# EasyEDA Pro project alcometerLayout_v3.epro

# Board PCB_ESP32 Tutorial
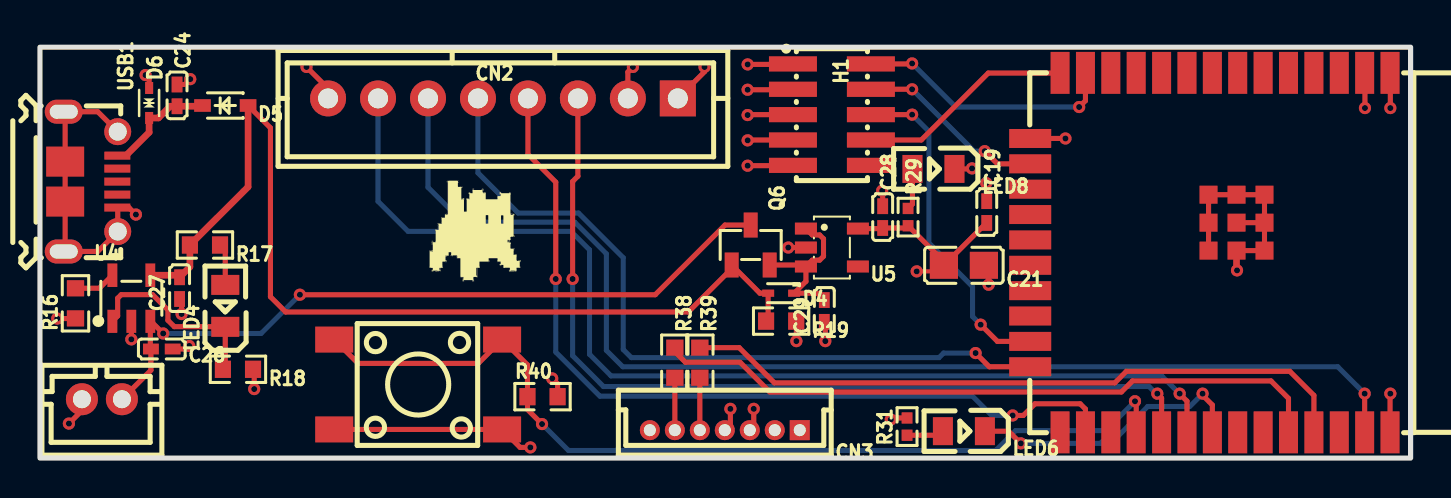
[diagram p0: board, top side]
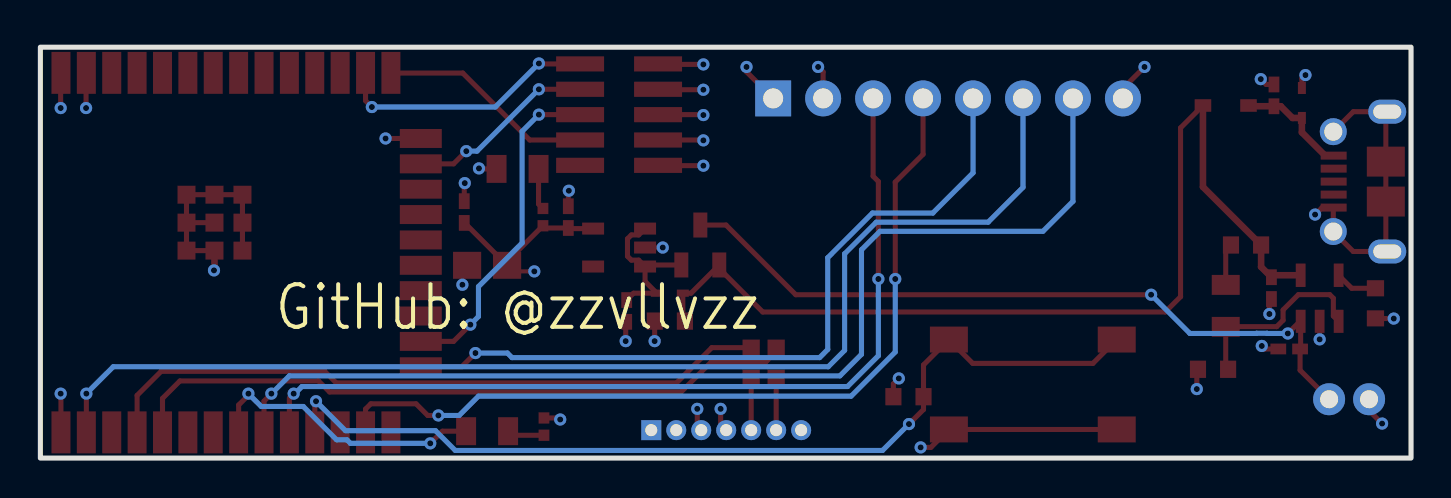
[diagram p1: board, bottom side, seen from below]

Outline 68.58 x 20.57 mm; copper layers: Top Layer, Inner1, Inner2, Bottom Layer. Coordinates in mm from the lower left corner of the outline.
Outline path: rectangle 0,20.57 68.58,0
Stack: Top Layer 0.035mm Outer layer thickness 1oz / Dielectric1 0.2104mm 7628 RC49% 8.6mil / Inner1 0.0152mm Inner layer thickness / Dielectric2 1.065mm 1.1mm H/HOZ Copper / Inner2 0.0152mm Inner layer thickness / Dielectric3 0.2104mm 7628 RC49% 8.6mil / Bottom Layer 0.035mm Outer layer thickness 1oz

## Design rules (mm)
template: User Custom Config
spacing Default (default): track to track 0.203, other pairs 0 to 0.203
spacing USB: track to track 0.152, other pairs 0 to 0.203
track width Default (default): min 0.203, default 0.203, max 25.4
track width USB: min 0.152, default 0.152, max 25.4
differential pair differentialPair (default): width min 0.127, default 0.254, max 2.54; gap min 0.152, default 0.152
via Default (default): diameter min 0.61, default 0.61, max 100.025; hole min 0.305, default 0.305, max 59.995
via USB: diameter min 0.61, default 0.61, max 100.025; hole min 0.305, default 0.305, max 59.995

## Placement (name value [footprint] x y rotation side)
C19  100nF  [C0402]  47.37 12.32 270 top
C21  22uF  [C0805]  46.23 9.65 180 top
C24  100nF  [C0402]  6.86 18.16 270 top
C26  10uF  [C0402]  6.1 5.46 180 top
C27  10uF  [C0402]  6.98 8.51 90 top
C28  10uF  [C0402]  42.16 12.07 270 top
C29  10uF  [C0402]  39.24 7.37 90 top
CN1  B2B-PH-K-S(LF)(SN)  [CONN-TH_B2B-PH-K-S]  3.1 2.95 180 top
CN2  XH-8A  [CONN-TH_8P-P2.50_HCTL_XH-8A_C53055484]  23.16 18.01 0 top
CN3  1.25mm-7P ZZ-MS  [CONN-TH_7P-P1.25_1.25MM-7P-ZZ-MS]  34.26 1.4 180 top
D4  RB521S30T1G  [SOD-523_L1.2-W0.8-LS1.6-RD]  37.08 8.26 180 top
D5  BAT760-7  [SOD-323_L1.7-W1.3-LS2.6-FD-1]  9.27 17.65 180 top
D6  LESD5D5.0CT1G  [SOD-523_L1.2-W0.8-LS1.6-BI]  5.46 17.78 270 top
H1  20021121-00010C4LF  [HDR-SMD_10P-P1.27-V-M-R2-C5-S1.27-LS5.5]  39.62 17.2 270 top
LED4  KT-0805R  [LED0805-R-RD]  9.27 7.62 90 top
LED6  NCD0805R1  [LED0805-R-RD]  46.23 1.35 180 top
LED8  KT-0805G  [LED0805-R-RD]  44.7 14.48 180 top
Q6  AO3401  [SOT-23-3_L2.9-W1.3-P0.95-LS2.4-BR]  35.56 10.67 270 top
R16  3K  [R0603]  1.78 7.75 90 top
R17  1K  [R0603]  8.25 10.67 180 top
R18  1K  [R0603]  9.91 4.45 180 top
R19  100K  [R0603]  37.08 6.86 180 top
R29  5.1kΩ  [R0402]  43.43 12.07 270 top
R31  560Ω  [R0402]  43.38 1.58 90 top
R38  0R  [R0603]  31.76 4.78 270 top
R39  0R  [R0603]  33.01 4.78 270 top
R40  10K  [R0603]  25.15 3.07 0 top
SW7  TS-1002S-05026C  [KEY-SMD_4P-L6.0-W6.0-P4.50-LS9.0]  18.92 3.68 0 top
U4  MCP73831T-2ACI/OT  [SOT-23-5_L3.0-W1.7-P0.95-LS2.8-BL]  4.57 8 0 top
U5  ME6217C33M5G  [SOT-23-5_L3.0-W1.7-P0.95-LS2.8-BR]  39.62 10.54 180 top
U8  ESP32-WROOM-32E-N8  [WIFI-SMD_ESP32-WROOM-32E]  58.55 10.29 180 top
USB1  1050170001  [MICRO-USB-SMD_105017-0001]  2.54 13.84 270 top

## Footprints (pads in the part's own frame, mm; a bottom-side part is the same pattern mirrored in y, then rotated)
C0402
  rect 0.79x0.54 smd: 1(-0.545,0) 2(0.545,0)
C0805
  rect 1.41x1.35 smd: 1(-1,0) 2(1,0)
CONN-TH_7P-P1.25_1.25MM-7P-ZZ-MS
  rect 1x1 hole 0.6: 1(-3.75,0)
  round 1 hole 0.6: 2(-2.5,0) 3(-1.25,0) 4(0,0) 5(1.25,0) 6(2.5,0) 7(3.75,0)
CONN-TH_8P-P2.50_HCTL_XH-8A_C53055484
  rect 1.8x1.8 hole 1: 1(8.75,0.001)
  round 1.8 hole 1: 2(6.25,0.001) 3(3.749,0.001) 4(1.25,0) 5(-1.25,0) 6(-3.75,-0.001) 7(-6.25,-0.001) 8(-8.75,-0.001)
CONN-TH_B2B-PH-K-S
  round 1.6 hole 0.9: 1(1,0) 2(-1,0)
HDR-SMD_10P-P1.27-V-M-R2-C5-S1.27-LS5.5
  rect 0.76x2.4 smd: 1(-2.54,-1.95) 2(-2.54,1.95) 3(-1.27,-1.95) 4(-1.27,1.95) 5(0,-1.95) 6(0,1.95) 7(1.27,-1.95) 8(1.27,1.95) 9(2.54,-1.95) 10(2.54,1.95)
KEY-SMD_4P-L6.0-W6.0-P4.50-LS9.0
  rect 1.9x1.3 smd: 1(-4.2,2.25) 2(4.2,2.25) 3(-4.2,-2.25) 4(4.2,-2.25)
LED0805-R-RD
  rect 1x1.399 smd: 1(1.05,0) 2(-1.05,0)
MICRO-USB-SMD_105017-0001
  rect 0.4x1.3 smd: 1(-1.3,1.33) 2(-0.65,1.33) 3(0,1.33) 4(0.65,1.33) 5(1.3,1.33)
  round 1.35 hole 0.9: 6(-2.5,1.35) 7(2.5,1.35)
  oval 1.2x1.9 hole 0.7x1.4: 8(3.5,-1.35) 9(-3.5,-1.35)
  rect 1.5x1.9 smd: 10(-1,-1.28) 10(1,-1.28)
R0402
  rect 0.566x0.54 smd: 1(-0.433,0) 2(0.433,0)
R0603
  rect 0.806x0.864 smd: 1(-0.753,0) 2(0.753,0)
SOD-323_L1.7-W1.3-LS2.6-FD-1
  rect 0.83x0.63 smd: 1(-1.14,0) 2(1.14,0)
SOD-523_L1.2-W0.8-LS1.6-BI
  rect 0.6x0.4 smd: 1(-0.75,0) 2(0.75,0)
SOD-523_L1.2-W0.8-LS1.6-RD
  rect 0.6x0.36 smd: 1(-0.65,0) 2(0.65,0)
SOT-23-3_L2.9-W1.3-P0.95-LS2.4-BR
  rect 1.25x0.7 smd: 1(1,-0.95) 2(1,0.95) 3(-1,0)
SOT-23-5_L3.0-W1.7-P0.95-LS2.8-BL
  rect 0.49x1.157 smd: 1(-0.95,-1.153) 2(0,-1.153) 3(0.95,-1.153)
  rect 0.49x1.175 smd: 4(0.95,1.153) 5(-0.95,1.153)
SOT-23-5_L3.0-W1.7-P0.95-LS2.8-BR
  rect 1.1x0.6 smd: 1(1.3,-0.95) 2(1.3,0) 3(1.3,0.95) 4(-1.3,0.95) 5(-1.3,-0.95)
WIFI-SMD_ESP32-WROOM-32E
  rect 0.95x2.1 smd: 1(-9.002,-9) 2(-7.732,-9) 3(-6.463,-9) 4(-5.192,-9) 5(-3.922,-9) 6(-2.652,-9) 7(-1.383,-9) 8(-0.113,-9) 9(1.157,-9) 10(2.428,-9) 11(3.697,-9) 12(4.968,-9) 13(6.237,-9) 14(7.508,-9) 25(7.508,9) 26(6.237,9) 27(4.968,9) 28(3.697,9) 29(2.428,9) 30(1.157,9) 31(-0.113,9) 32(-1.383,9) 33(-2.652,9) 34(-3.922,9) 35(-5.192,9) 36(-6.463,9) 37(-7.732,9) 38(-9.002,9)
  rect 2.1x0.95 smd: 15(9.002,-5.715) 16(9.002,-4.445) 17(9.002,-3.175) 18(9.002,-1.905) 19(9.002,-0.635) 20(9.002,0.635) 21(9.002,1.905) 22(9.002,3.175) 23(9.002,4.445) 24(9.002,5.715)
  rect 0.9x0.9 smd: 39(-2.721,-0.1) 39(-2.721,-1.5) 39(-2.721,-2.9) 39(-1.321,-0.1) 39(-1.321,-1.5) 39(-1.321,-2.9) 39(0.079,-0.1) 39(0.079,-1.5) 39(0.079,-2.9)

## Nets
+3V3: C19.2 C21.2 C28.2 CN2.1 CN2.8 CN3.4 H1.1 R29.2 R31.2 R40.2 U5.5 U8.2
+5V_VBUS: C24.2 D5.2 D6.2 USB1.1
GND: C19.1 C21.1 C24.1 C26.1 C27.1 C28.1 C29.1 CN1.1 CN2.2 CN3.3 D6.1 H1.3 H1.5 H1.7 H1.9 LED8.2 R16.1 R18.1 R19.1 SW7.3 SW7.4 U4.2 U5.2 U8.1 U8.15 U8.38 U8.39 USB1.5 USB1.6 USB1.7 USB1.8 USB1.9 USB1.10
VBAT: C26.2 CN1.2 Q6.3 U4.3
EXT_5V: C27.2 D4.2 D5.1 Q6.1 R17.2 R19.2 U4.4
IO2: CN2.5 U8.24
IO4: CN2.4 U8.26
IO5: CN2.3 U8.29
IO12: H1.8 U8.14
IO13: H1.4 U8.16
IO14: H1.2 U8.13
IO15: H1.6 U8.23
IO17: R40.1 SW7.1 SW7.2 U8.28
IO18: CN2.7 U8.30
IO19: LED6.2 U8.31
IO23: CN2.6 U8.37
RXD: CN3.5 R39.2
RXD0: R38.1 U8.34
STAT: LED4.2 R18.2 U4.1
TXD: CN3.6 R38.2
TXD0: R39.1 U8.35
$1N80: LED8.1 R29.1
$1N127: LED6.1 R31.1
$1N2941: R16.2 U4.5
$1N3078: LED4.1 R17.1
$1N4537: C29.2 D4.1 Q6.2 U5.1 U5.3

Pads without a net: CN3 1 2 7; H1 10; U5 4; U8 3 4 5 6 7 8 9 10 11 12 17 18 19 20 21 22 25 27 32 33 36; USB1 2 3 4

## Via types
v1: diameter 0.61, hole 0.305, Top Layer to Bottom Layer, 54 vias

## Routing (per net, layer and track width the routed paths; a pad name or vN(x,y) marks a point on that pad's centre or on a via; arc(x,y) is an arc through that point)
+3V3: length 21
  Top Layer w0.203: C21.2 44.92,9.35 v1(43.87,9.35)
  Top Layer w0.254: H1.1 37.65,19.71 v1(35.41,19.71) ; R40.2 25.9,3.72 v1(25.63,3.99) ; v1(34.54,2.46) 34.54,1.68 CN3.4 ; v1(13.34,19.58) 14.41,18.5 14.41,18.01 ; v1(33.25,19.58) 33.25,19.34 CN2.1 ; R31.2 42.65,2.01 v1(42.57,1.93) ; U5.5 42.13,11.49 C28.2 43.32,11.52 R29.2 45.23,9.84 C21.2 47.35,11.77 C19.2 ; v1(66.29,17.53) 66.29,19.27 U8.2
+5V_VBUS: length 5.7
  Top Layer w0.33: D5.2 8.09,17.62 C24.2 6.52,17.62 5.93,17.03 D6.2 5.46,16.31 4.3,15.14 USB1.1
GND: length 69.4
  Top Layer w0.254: 14.72,1.43 SW7.4 24.02,0.53 v1(24.54,0.53) ; R19.1 37.85,6.85 v1(37.85,5.86) ; v1(67.56,17.53) 67.56,19.27 U8.1 ; v1(35.41,14.64) 37.66,14.64 H1.9 ; U8.39 U8.39 U8.39 ; U8.39 59.87,11.79 ; U8.39 U8.39 U8.39 U8.39 U8.39 U8.39 ; C24.1 7.25,18.71 v1(7.52,18.97) ; v1(10.72,3.45) 10.72,4.39 R18.1 ; v1(39.29,5.86) 39.29,6.77 39.24,6.82 ; U8.38 67.55,3.21 v1(67.56,3.23) ; v1(47.35,13.77) 47.37,13.74 C19.1 ; v1(29.67,19.58) 29.41,19.33 29.41,18.01 ; H1.7 35.43,15.93 v1(35.41,15.91) ; R16.1 1.77,6.99 v1(0.86,6.99) ; v1(7.47,5.61) 7.31,5.46 C26.1 ; v1(42.14,13.39) 42.16,13.36 C28.1 ; v1(46.63,14.5) 46.61,14.48 LED8.2 ; 37.41,10.57 v1(37.44,10.54) U5.2 ; v1(5.28,19.18) 5.46,19 D6.1 ; v1(35.41,18.44) 37.65,18.44 H1.3 ; CN1.1 2.1,2.38 v1(1.45,1.73) ; v1(4.8,12.19) 4.45,12.54 USB1.5 3.89,12.52 USB1.7 2.89,10.34 USB1.8 1.26,10.41 USB1.10 USB1.10 1.26,17.27 USB1.9 2.89,17.34 USB1.6 ; v1(7.09,7.21) 7.09,7.86 C27.1 ; CN3.3 35.71,1.6 v1(35.71,2.46) ; U4.2 v1(4.57,5.94) ; H1.5 35.43,17.2 v1(35.41,17.18) ; v1(47.46,8.68) 47.46,9.42 C21.1 ; U8.15 v1(51.31,16)
  Top Layer w0.33: U8.39 59.87,9.42 v1(59.89,9.4)
VBAT: length 37.1
  Top Layer w0.254: CN1.2 5.55,4.4 C26.2 5.52,5.49 U4.3 5.55,6.85 v1(6.16,6.24) ; v1(13,8.18) 30.78,8.18 34.27,11.67 Q6.3
  Bottom Layer w0.254: v1(6.16,6.24) 7.19,6.24 7.2,6.25 7.73,6.25 7.74,6.24 11.06,6.24 v1(13,8.18)
EXT_5V: length 49.9
  Top Layer w0.254: R19.2 36.43,6.96 D4.2 36.02,8.26 Q6.1 34.61,9.49 32.44,7.31 12.3,7.31 11.53,8.08 11.53,16.53 D5.1
  Top Layer w0.33: D5.1 10.41,13.58 R17.2 7.5,9.57 C27.2 6.88,9.15 U4.4
IO2: length 38.3
  Top Layer w0.254: U8.24 47.5,4.57 v1(46.81,5.26)
  Bottom Layer w0.254: 21.91,18.01 21.91,14.28 23.93,12.27 26.95,12.27 29.18,10.03 29.18,5.44 29.59,5.03 44.98,5.03 45.21,5.26 v1(46.81,5.26)
IO4: length 42.6
  Top Layer w0.254: v1(48.67,2.13) 49.2,2.13 49.78,2.72 52.04,2.72 52.31,2.45 U8.26 ; v1(25.81,8.97) 25.81,13.82 24.41,15.21 24.41,18.01
  Bottom Layer w0.254: v1(25.81,8.97) 25.81,5.31 28.02,3.1 46.66,3.1 47.62,2.13 v1(48.67,2.13)
IO5: length 45.1
  Top Layer w0.254: CN2.3 26.91,14.11 26.65,13.85 v1(26.65,8.97) ; 55.91,3.22 56.12,3 U8.29
  Bottom Layer w0.254: v1(26.65,8.97) 26.65,5.12 28.19,3.58 55.49,3.58 55.85,3.22 55.91,3.22
  vias: v1(55.91,3.23)
IO12: length 10.9
  Top Layer w0.254: U8.14 51.03,19.28 47.45,19.28 44.09,15.93 H1.8
IO13: length 9.5
  Top Layer w0.254: v1(47.27,15.37) 47.9,14.73 U8.16 ; H1.4 43.64,18.47
  Bottom Layer w0.254: v1(47.27,15.37) 46.73,15.37 v1(43.64,18.46)
IO14: length 13.2
  Top Layer w0.254: H1.2 43.61,19.74 v1(43.64,19.76) ; v1(51.99,17.58) 52.31,17.89 U8.13
  Bottom Layer w0.254: v1(43.64,19.76) 45.82,17.58 v1(51.99,17.58)
IO15: length 16.8
  Top Layer w0.254: U8.23 47.9,5.84 v1(47.07,6.68) ; H1.6 v1(43.64,17.2)
  Bottom Layer w0.254: v1(47.07,6.68) 46.66,7.09 46.66,8.58 44.48,10.77 44.48,16.36 v1(43.64,17.2)
IO17: length 47.3
  Top Layer w0.254: U8.28 54.85,2.78 v1(54.79,2.85) ; 14.72,5.93 15.91,4.74 21.93,4.74 SW7.2 24.39,4.66 R40.1 24.39,2.43 v1(25.12,1.7)
  Bottom Layer w0.254: v1(25.12,1.7) 26.44,0.38 47.82,0.38 48.81,1.37 53.31,1.37 v1(54.79,2.85)
IO18: length 54.4
  Top Layer w0.254: U8.30 57.39,2.85 57.02,3.22
  Bottom Layer w0.254: 16.91,18.01 16.91,12.85 18.41,11.35 26.57,11.35 27.5,10.43 27.5,5.19 28.57,4.12 56.12,4.12 57.02,3.22
  vias: v1(57.02,3.23)
IO19: length 14.3
  Top Layer w0.254: LED6.2 48.46,1.35 v1(49.07,0.74) ; v1(58.17,3.23) 58.17,3.14 58.66,2.66 U8.31
  Bottom Layer w0.254: v1(58.17,3.23) 57.53,2.58 55.42,2.58 53.76,0.91 53.24,0.91 53.07,0.74 v1(49.07,0.74)
IO23: length 60.4
  Top Layer w0.254: U8.37 v1(66.28,3.23)
  Bottom Layer w0.254: v1(66.28,3.23) 64.93,4.57 29.16,4.57 28.34,5.39 28.34,10.23 26.76,11.81 21.16,11.81 19.41,13.55 19.41,18.01
RXD: length 2.6
  Top Layer w0.254: R39.2 33.01,1.4
RXD0: length 34
  Top Layer w0.254: R38.1 31.76,5.32 32.29,4.8 35.03,4.8 36.52,3.31 54.11,3.31 54.66,3.86 61.59,3.86 62.47,2.99 U8.34
STAT: length 9.9
  Top Layer w0.254: R18.2 9.27,4.56 LED4.2 9.26,6.58 6.72,6.58 6.4,6.9 6.4,7.42 5.64,8.18 4.07,8.18 3.89,8 3.89,7.11 U4.1
TXD: length 2.6
  Top Layer w0.254: R38.2 CN3.6
TXD0: length 34
  Top Layer w0.254: U8.35 63.74,3.14 62.53,4.34 54.36,4.34 53.78,3.77 36.75,3.77 34.98,5.53 R39.1
$1N80: length 2.1
  Top Layer w0.254: LED8.1 43.65,12.72 R29.1
$1N127: length 1.9
  Top Layer w0.254: LED6.1 44.97,1.14 R31.1
$1N2941: length 2.1
  Top Layer w0.254: U4.5 2.97,8.5 R16.2
$1N3078: length 2.1
  Top Layer w0.254: LED4.1 9.27,10.41 R17.1
$1N4537: length 8.1
  Top Layer w0.254: C29.2 38.9,8.26 D4.1 38.32,8.85 U5.3 ; U5.3 38.64,9.91 39.01,9.91 39.2,10.1 39.2,10.98 39.01,11.17 38.64,11.17 U5.1 ; U5.3 38.25,9.67 Q6.2

## Copper pours and planes (outline as drawn; the poured copper is in the pictures)
+3V3 on Inner2: 12.8,18.46 13.97,18.46 13.97,17.56 12.8,17.56
+3V3 on Inner2: 32.36,18.46 33.53,18.46 33.53,17.56 32.36,17.56
+3V3 on Inner2: 31.46,17.57 32.37,17.57 32.37,16.4 31.46,16.4
+3V3 on Inner2: 31.46,19.62 32.37,19.62 32.37,18.45 31.46,18.45
+3V3 on Inner2: 13.96,19.62 14.87,19.62 14.87,18.45 13.96,18.45
+3V3 on Inner2: 13.96,17.57 14.87,17.57 14.87,16.4 13.96,16.4
+3V3 on Inner2: 0.21,20.37 68.37,20.37 68.37,0.21 0.21,0.21
GND on Inner1: 28.96,17.57 29.87,17.57 29.87,16.4 28.96,16.4
GND on Inner1: 0.71,18.68 1.67,18.68 1.67,17.46 0.71,17.46
GND on Inner1: 0.71,17.23 1.67,17.23 1.67,16.01 0.71,16.01
GND on Inner1: 0.71,10.23 1.67,10.23 1.67,9.01 0.71,9.01
GND on Inner1: 28.96,19.62 29.87,19.62 29.87,18.45 28.96,18.45
GND on Inner1: 0.71,11.68 1.67,11.68 1.67,10.46 0.71,10.46
GND on Inner1: 0.21,20.37 68.37,20.37 68.37,0.21 0.21,0.21

Small or netless copper shapes (teardrops, artwork), in the pictures only: 15 on Inner1, 2 on Inner2

## Text on the board
Bottom Silkscreen Layer: GitHub: @zzvllvzz
Top Silkscreen Layer: 1
